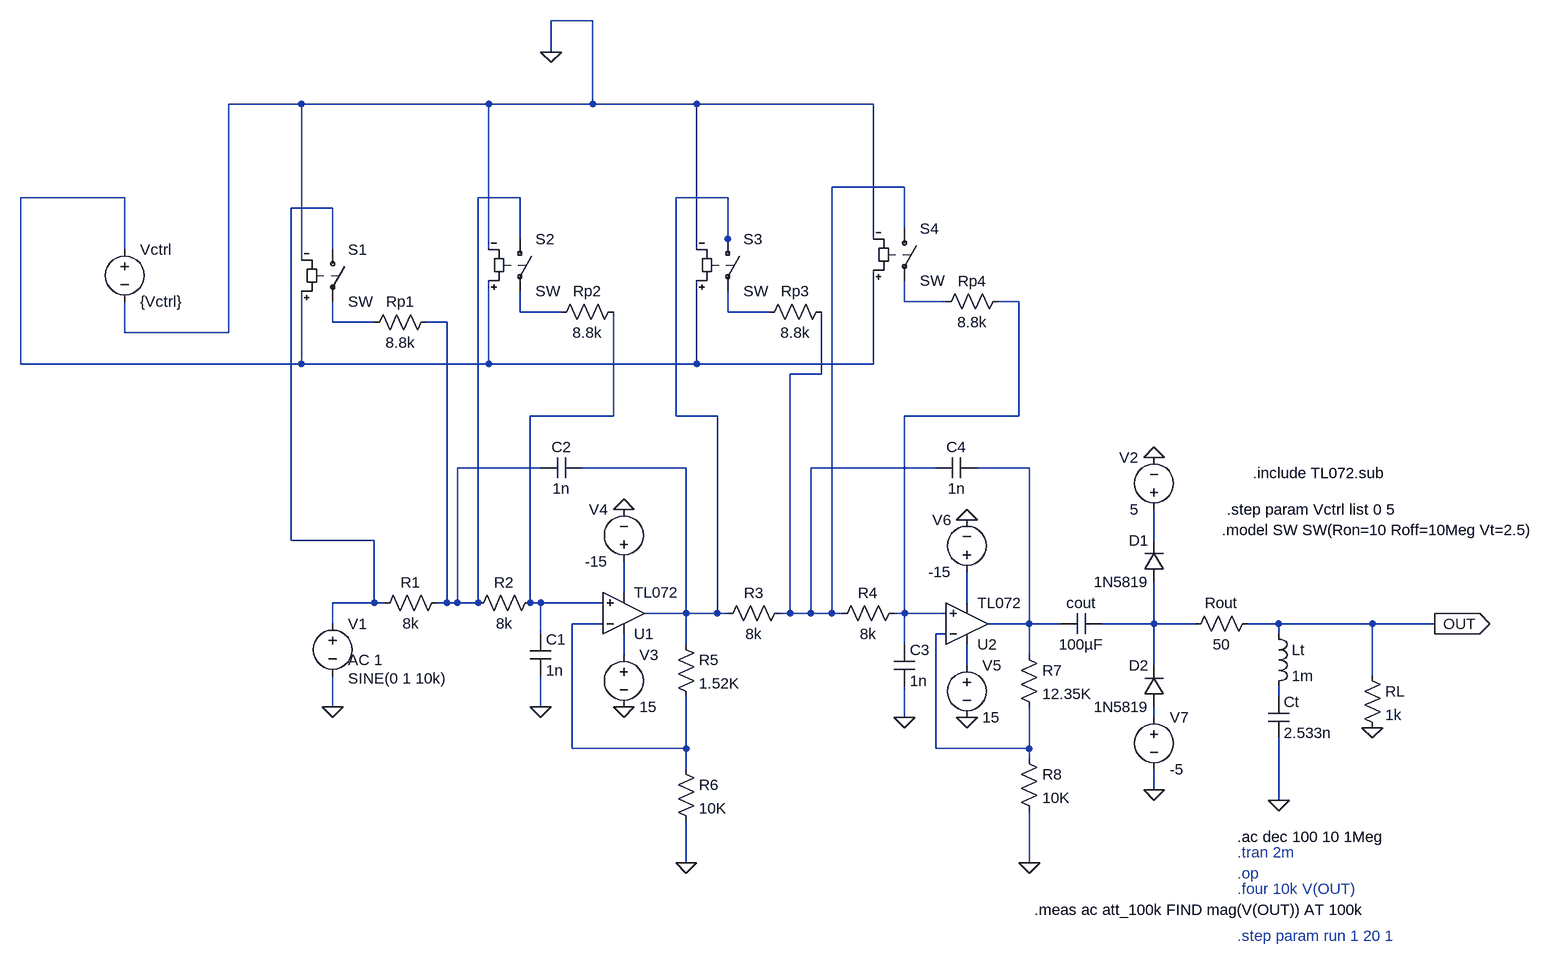
[diagram p0: schematic sallen_key_4th_order.asc]
sallen_key_4th_order.asc, the LTspice schematic file:
Version 4.1
SHEET 1 1836 992
WIRE -400 -1104 -464 -1104
WIRE -464 -1056 -464 -1104
WIRE -848 -976 -960 -976
WIRE -560 -976 -848 -976
WIRE -400 -976 -400 -1104
WIRE -400 -976 -560 -976
WIRE -240 -976 -400 -976
WIRE 32 -976 -240 -976
WIRE 80 -848 -32 -848
WIRE -1120 -832 -1280 -832
WIRE -512 -832 -576 -832
WIRE -192 -832 -272 -832
WIRE -800 -816 -864 -816
WIRE 80 -784 80 -848
WIRE -512 -768 -512 -832
WIRE -192 -768 -192 -832
WIRE 32 -768 32 -976
WIRE -1120 -752 -1120 -832
WIRE -800 -752 -800 -816
WIRE -560 -752 -560 -976
WIRE -240 -752 -240 -976
WIRE -192 -752 -192 -768
WIRE -848 -736 -848 -976
WIRE 80 -672 80 -704
WIRE 144 -672 80 -672
WIRE 256 -672 224 -672
WIRE -512 -656 -512 -688
WIRE -448 -656 -512 -656
WIRE -192 -656 -192 -688
WIRE -128 -656 -192 -656
WIRE -800 -640 -800 -672
WIRE -736 -640 -800 -640
WIRE -624 -640 -656 -640
WIRE -1120 -624 -1120 -672
WIRE -960 -624 -960 -976
WIRE -960 -624 -1120 -624
WIRE -1280 -576 -1280 -832
WIRE -848 -576 -848 -688
WIRE -848 -576 -1280 -576
WIRE -560 -576 -560 -704
WIRE -560 -576 -848 -576
WIRE -240 -576 -240 -704
WIRE -240 -576 -560 -576
WIRE 32 -576 32 -720
WIRE 32 -576 -240 -576
WIRE -48 -560 -48 -656
WIRE -48 -560 -96 -560
WIRE -368 -496 -368 -656
WIRE -368 -496 -496 -496
WIRE -272 -496 -272 -832
WIRE -208 -496 -272 -496
WIRE 256 -496 256 -672
WIRE 256 -496 80 -496
WIRE -480 -416 -608 -416
WIRE -256 -416 -416 -416
WIRE 128 -416 -64 -416
WIRE 272 -416 192 -416
WIRE -864 -304 -864 -816
WIRE -736 -304 -864 -304
WIRE 464 -304 464 -352
WIRE -352 -224 -352 -272
WIRE -736 -208 -736 -304
WIRE -736 -208 -800 -208
WIRE -720 -208 -736 -208
WIRE -624 -208 -624 -640
WIRE -624 -208 -640 -208
WIRE -608 -208 -608 -416
WIRE -608 -208 -624 -208
WIRE -576 -208 -576 -832
WIRE -576 -208 -608 -208
WIRE -496 -208 -496 -496
WIRE -480 -208 -496 -208
WIRE -384 -208 -480 -208
WIRE 176 -208 176 -256
WIRE -256 -192 -256 -416
WIRE -256 -192 -320 -192
WIRE -208 -192 -208 -496
WIRE -208 -192 -256 -192
WIRE -192 -192 -208 -192
WIRE -96 -192 -96 -560
WIRE -96 -192 -112 -192
WIRE -64 -192 -64 -416
WIRE -64 -192 -96 -192
WIRE -32 -192 -32 -848
WIRE -32 -192 -64 -192
WIRE -16 -192 -32 -192
WIRE 80 -192 80 -496
WIRE 80 -192 64 -192
WIRE 144 -192 80 -192
WIRE -800 -176 -800 -208
WIRE -384 -176 -432 -176
WIRE 272 -176 272 -416
WIRE 272 -176 208 -176
WIRE 320 -176 272 -176
WIRE 464 -176 464 -240
WIRE 464 -176 384 -176
WIRE 528 -176 464 -176
WIRE 656 -176 608 -176
WIRE 800 -176 656 -176
WIRE 896 -176 800 -176
WIRE -480 -160 -480 -208
WIRE 144 -160 128 -160
WIRE 656 -160 656 -176
WIRE -256 -144 -256 -192
WIRE 80 -144 80 -192
WIRE -352 -128 -352 -160
WIRE 272 -128 272 -176
WIRE 176 -112 176 -144
WIRE 464 -112 464 -176
WIRE 800 -96 800 -176
WIRE 656 -64 656 -80
WIRE -800 -48 -800 -96
WIRE -480 -48 -480 -96
WIRE 80 -32 80 -80
WIRE 464 -32 464 -48
WIRE -432 16 -432 -176
WIRE -256 16 -256 -64
WIRE -256 16 -432 16
WIRE 128 16 128 -160
WIRE 272 16 272 -48
WIRE 272 16 128 16
WIRE 272 32 272 16
WIRE -256 48 -256 16
WIRE 464 80 464 48
WIRE 656 96 656 0
WIRE -256 192 -256 128
WIRE 272 192 272 112
FLAG -800 -48 0
FLAG 896 -176 OUT
IOPIN 896 -176 Out
FLAG -480 -48 0
FLAG 80 -32 0
FLAG 464 -432 0
FLAG -352 -352 0
FLAG -352 -48 0
FLAG 176 -32 0
FLAG 176 -336 0
FLAG -256 192 0
FLAG 272 192 0
FLAG 464 80 0
FLAG -464 -1056 0
FLAG 656 96 0
FLAG 800 -16 0
SYMBOL voltage -800 -192 R0
WINDOW 123 24 72 Left 2
WINDOW 39 0 0 Left 0
WINDOW 3 24 100 Left 2
SYMATTR Value2 AC 1
SYMATTR Value SINE(0 1 10k)
SYMATTR InstName V1
SYMBOL cap 384 -192 R90
WINDOW 0 0 32 VBottom 2
WINDOW 3 32 32 VTop 2
SYMATTR InstName cout
SYMATTR Value 100µF
SYMBOL diode 480 -240 R180
WINDOW 0 24 64 Left 2
WINDOW 3 24 0 Left 2
SYMATTR InstName D1
SYMATTR Value 1N5819
SYMBOL diode 480 -48 R180
WINDOW 0 24 64 Left 2
WINDOW 3 24 0 Left 2
SYMATTR InstName D2
SYMATTR Value 1N5819
SYMBOL res 624 -192 R90
WINDOW 0 0 56 VBottom 2
WINDOW 3 32 56 VTop 2
SYMATTR InstName Rout
SYMATTR Value 50
SYMBOL res -624 -224 R90
WINDOW 0 0 56 VBottom 2
WINDOW 3 32 56 VTop 2
SYMATTR InstName R1
SYMATTR Value 8k
SYMBOL res -480 -224 R90
WINDOW 0 0 56 VBottom 2
WINDOW 3 32 56 VTop 2
SYMATTR InstName R2
SYMATTR Value 8k
SYMBOL cap -496 -160 R0
SYMATTR InstName C1
SYMATTR Value 1n
SYMBOL res -96 -208 R90
WINDOW 0 0 56 VBottom 2
WINDOW 3 32 56 VTop 2
SYMATTR InstName R3
SYMATTR Value 8k
SYMBOL res 80 -208 R90
WINDOW 0 0 56 VBottom 2
WINDOW 3 32 56 VTop 2
SYMATTR InstName R4
SYMATTR Value 8k
SYMBOL cap 64 -144 R0
SYMATTR InstName C3
SYMATTR Value 1n
SYMBOL cap 192 -432 R90
WINDOW 0 0 32 VBottom 2
WINDOW 3 32 32 VTop 2
SYMATTR InstName C4
SYMATTR Value 1n
SYMBOL voltage 464 -336 R180
WINDOW 0 24 96 Left 2
WINDOW 3 24 16 Left 2
WINDOW 123 0 0 Left 0
WINDOW 39 0 0 Left 0
SYMATTR InstName V2
SYMATTR Value 5
SYMBOL voltage -352 -144 R0
SYMATTR InstName V3
SYMATTR Value 15
SYMBOL voltage -352 -256 R180
WINDOW 0 24 96 Left 2
WINDOW 3 24 16 Left 2
SYMATTR InstName V4
SYMATTR Value -15
SYMBOL voltage 176 -128 R0
SYMATTR InstName V5
SYMATTR Value 15
SYMBOL voltage 176 -240 R180
WINDOW 0 24 96 Left 2
WINDOW 3 24 16 Left 2
SYMATTR InstName V6
SYMATTR Value -15
SYMBOL cap -416 -432 R90
WINDOW 0 0 32 VBottom 2
WINDOW 3 32 32 VTop 2
SYMATTR InstName C2
SYMATTR Value 1n
SYMBOL res -272 -160 R0
SYMATTR InstName R5
SYMATTR Value 1.52K
SYMBOL res -272 32 R0
SYMATTR InstName R6
SYMATTR Value 10K
SYMBOL res 256 -144 R0
SYMATTR InstName R7
SYMATTR Value 12.35K
SYMBOL res 256 16 R0
SYMATTR InstName R8
SYMATTR Value 10K
SYMBOL voltage 464 -48 R0
SYMATTR InstName V7
SYMATTR Value -5
SYMBOL OpAmps\\opamp2 -352 -128 M180
SYMATTR InstName U1
SYMATTR Value TL072
SYMBOL OpAmps\\opamp2 176 -112 M180
SYMATTR InstName U2
SYMATTR Value TL072
SYMBOL ind 640 -176 R0
SYMATTR InstName Lt
SYMATTR Value 1m
SYMBOL sw -800 -768 R0
SYMATTR InstName S1
SYMBOL res -640 -656 R90
WINDOW 0 0 56 VBottom 2
WINDOW 3 32 56 VTop 2
SYMATTR InstName Rp1
SYMATTR Value 8.8k
SYMBOL sw -512 -784 R0
SYMATTR InstName S2
SYMBOL res -352 -672 R90
WINDOW 0 0 56 VBottom 2
WINDOW 3 32 56 VTop 2
SYMATTR InstName Rp2
SYMATTR Value 8.8k
SYMBOL sw -192 -784 R0
SYMATTR InstName S3
SYMBOL res -32 -672 R90
WINDOW 0 0 56 VBottom 2
WINDOW 3 32 56 VTop 2
SYMATTR InstName Rp3
SYMATTR Value 8.8k
SYMBOL sw 80 -800 R0
SYMATTR InstName S4
SYMBOL res 240 -688 R90
WINDOW 0 0 56 VBottom 2
WINDOW 3 32 56 VTop 2
SYMATTR InstName Rp4
SYMATTR Value 8.8k
SYMBOL voltage -1120 -768 R0
WINDOW 123 0 0 Left 0
WINDOW 39 0 0 Left 0
SYMATTR InstName Vctrl
SYMATTR Value {Vctrl}
SYMBOL cap 640 -64 R0
SYMATTR InstName Ct
SYMATTR Value 2.533n
SYMBOL res 784 -112 R0
SYMATTR InstName RL
SYMATTR Value 1k
TEXT 592 176 Left 2 ;.tran 2m
TEXT 280 264 Left 2 !.meas ac att_100k FIND mag(V(OUT)) AT 100k
TEXT 592 232 Left 2 ;.four 10k V(OUT)
TEXT 592 152 Left 2 !.ac dec 100 10 1Meg
TEXT 616 -408 Left 2 !.include TL072.sub
TEXT 592 208 Left 2 ;.op
TEXT 592 304 Left 2 ;.step param run 1 20 1
TEXT 576 -352 Left 2 !.step param Vctrl list 0 5
TEXT 568 -320 Left 2 !.model SW SW(Ron=10 Roff=10Meg Vt=2.5)

The netlist it stands for:
* sallen_key_4th_order.asc
V1 N005 0 SINE(0 1 10k) AC 1
cout N017 N012 100µF
D1 N017 N013 1N5819
D2 N022 N017 1N5819
Rout OUT N017 50
R1 N003 N005 8k
R2 N011 N003 8k
C1 N011 0 1n
R3 N001 N004 8k
R4 N007 N001 8k
C3 N007 0 1n
C4 N012 N001 1n
V2 N013 0 5
V3 N019 0 15
V4 N014 0 -15
V5 N020 0 15
V6 N015 0 -15
C2 N004 N003 1n
R5 N004 N016 1.52K
R6 N016 0 10K
R7 N012 N018 12.35K
R8 N018 0 10K
V7 N022 0 -5
X§U1 N011 N016 N019 N014 N004 TL072  ; pins In+ In- V+ V- OUT
X§U2 N007 N018 N020 N015 N012 TL072  ; pins In+ In- V+ V- OUT
Lt OUT N021 1m
S1 N005 N010 N002 0 SW
Rp1 N003 N010 8.8k
S2 N003 N008 N002 0 SW
Rp2 N011 N008 8.8k
S3 N004 N009 N002 0 SW
Rp3 N001 N009 8.8k
S4 N001 N006 N002 0 SW
Rp4 N007 N006 8.8k
Vctrl N002 0 {Vctrl}
Ct N021 0 2.533n
RL OUT 0 1k
.model D D
.lib standard.dio
* .tran 2m
.meas ac att_100k FIND mag(V(OUT)) AT 100k
* .four 10k V(OUT)
.ac dec 100 10 1Meg
.include TL072.sub
* .op
* .step param run 1 20 1
.step param Vctrl list 0 5
.model SW SW(Ron=10 Roff=10Meg Vt=2.5)
.backanno
.end